# Altium project T3-COM1-2.PrjPcb (part 4 of 6)
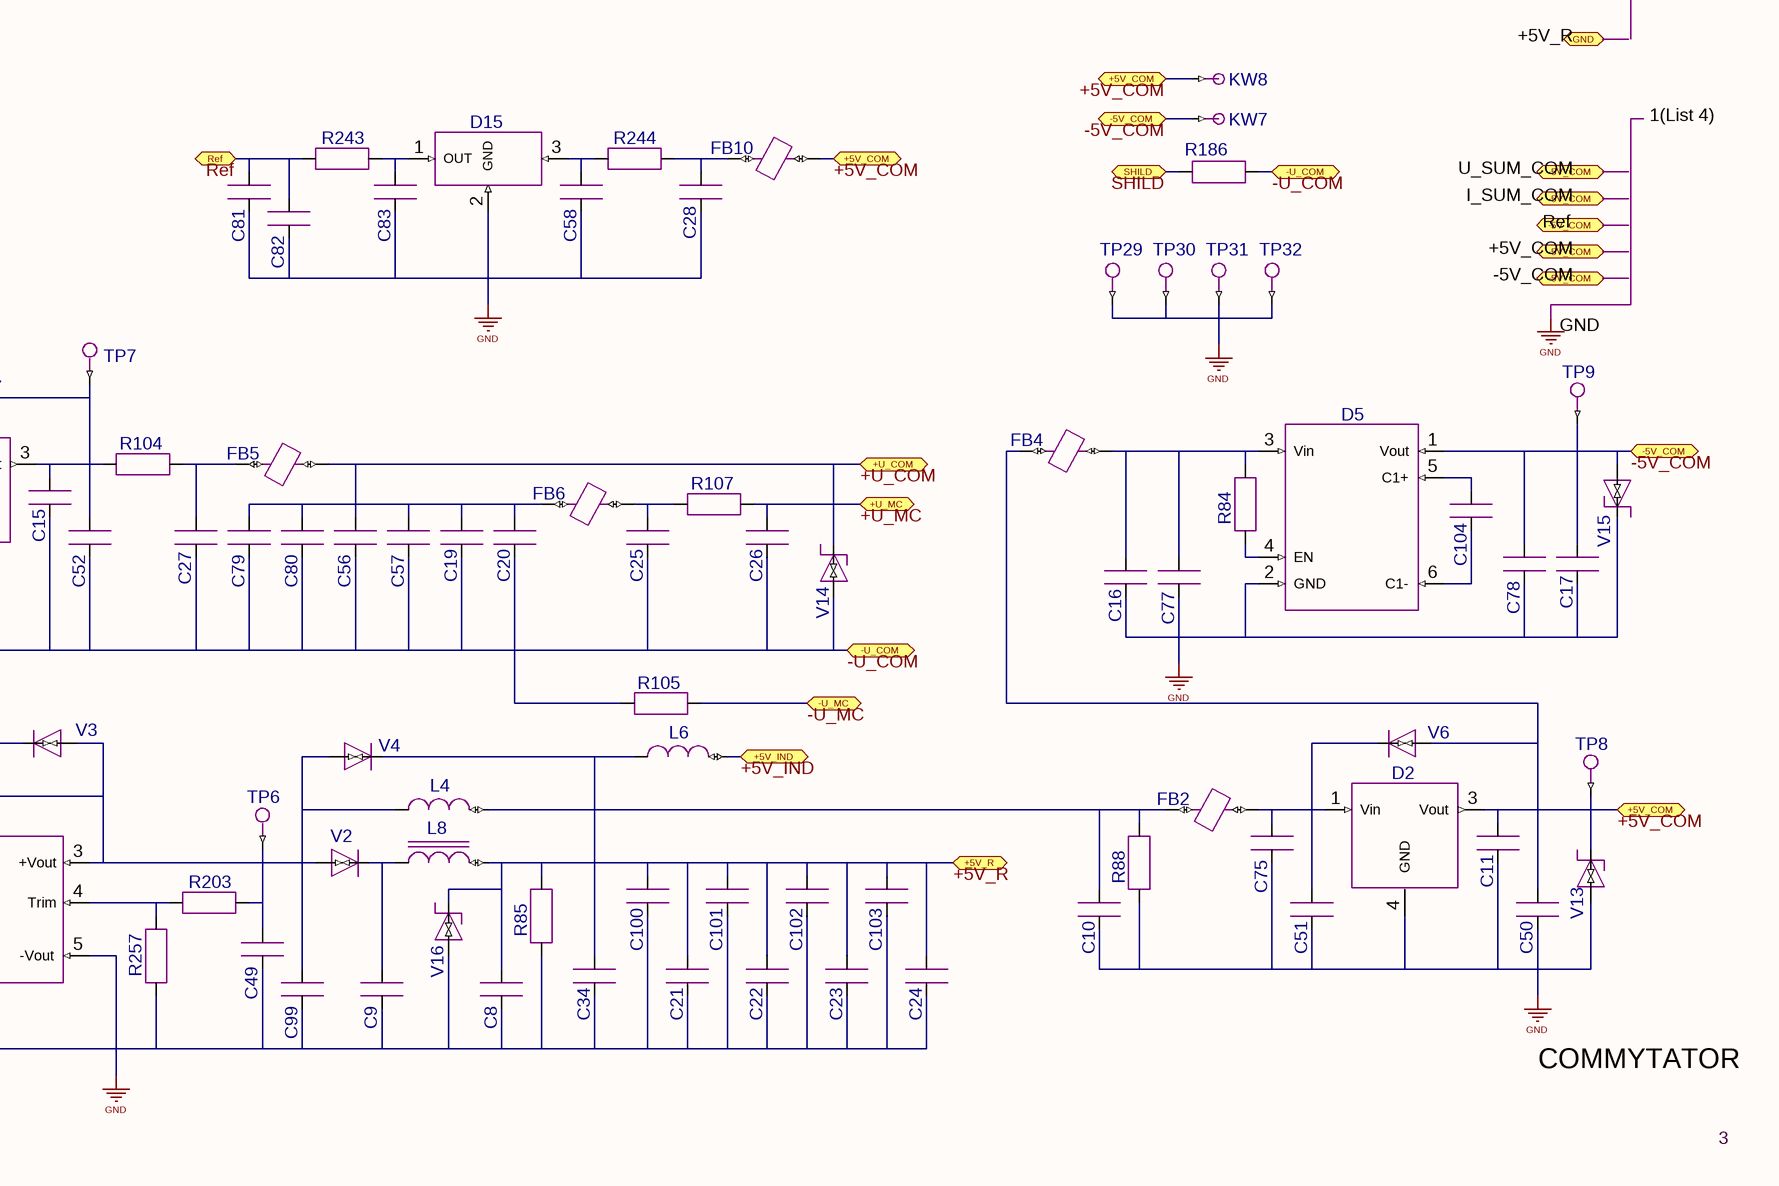
[diagram p17: Schematic1_3.SchDoc, bottom right]

## Sheet Schematic1_3.SchDoc (continued)

### Parts
C8  CAP CER 0.1UF 50V 10% X7R 0603  (value not drawn)
C9  CAP CER 0.1UF 50V 10% X7R 0603  (value not drawn)
C10  CAP CER 0.1UF 50V 10% X7R 0603  (value not drawn)
C11  CAP CER 0.1UF 50V 10% X7R 0603  (value not drawn)
C12  CAP CER 0.1UF 50V 10% X7R 0603  (value not drawn)
C13  CAP CER 0.1UF 50V 10% X7R 0603  (value not drawn)
C14  CAP CER 0.1UF 50V 10% X7R 0603  (value not drawn)
C15  CAP CER 0.1UF 50V 10% X7R 0603  (value not drawn)
C16  CAP CER 0.1UF 50V 10% X7R 0603  (value not drawn)
C17  CAP CER 0.1UF 50V 10% X7R 0603  (value not drawn)
C18  CAP CER 0.1UF 50V 10% X7R 0603  (value not drawn)
C19  CAP CER 0.1UF 50V 10% X7R 0603  (value not drawn)
C20  CAP CER 0.1UF 50V 10% X7R 0603  (value not drawn)
C21  CAP CER 0.1UF 50V 10% X7R 0603  (value not drawn)
C22  CAP CER 0.1UF 50V 10% X7R 0603  (value not drawn)
C23  CAP CER 0.1UF 50V 10% X7R 0603  (value not drawn)
C24  CAP CER 0.1UF 50V 10% X7R 0603  (value not drawn)
C25  CAP CER 0.1UF 50V 10% X7R 0603  (value not drawn)
C26  CAP CER 0.1UF 50V 10% X7R 0603  (value not drawn)
C27  CAP CER 0.1UF 50V 10% X7R 0603  (value not drawn)
C28  CAP CER 0.1UF 50V 10% X7R 0603  (value not drawn)
C29  CAP CER 0.1UF 50V 10% X7R 0603  (value not drawn)
C30  CAP CER 0.1UF 50V 10% X7R 0603  (value not drawn)
C31  CAP CER 0.1UF 50V 10% X7R 0603  (value not drawn)
C32  CAP CER 0.1UF 50V 10% X7R 0603  (value not drawn)
C33  CAP CER 0.1UF 50V 10% X7R 0603  (value not drawn)
C34  CAP CER 0.1UF 50V 10% X7R 0603  (value not drawn)
C35  CAP CER 0.1UF 50V 10% X7R 0603  (value not drawn)
C49  CAP CER 2.2UF 16V 10% X7R 0805  (value not drawn)
C50  CAP CER 2.2UF 16V 10% X7R 0805  (value not drawn)
C51  CAP CER 2.2UF 16V 10% X7R 0805  (value not drawn)
C52  CAP CER 2.2UF 16V 10% X7R 0805  (value not drawn)
C53  CAP CER 2.2UF 16V 10% X7R 0805  (value not drawn)
C54  CAP CER 2.2UF 16V 10% X7R 0805  (value not drawn)
C55  CAP CER 2.2UF 16V 10% X7R 0805  (value not drawn)
C56  CAP CER 2.2UF 16V 10% X7R 0805  (value not drawn)
C57  CAP CER 2.2UF 16V 10% X7R 0805  (value not drawn)
C58  CAP CER 2.2UF 16V 10% X7R 0805  (value not drawn)
C59  CAP CER 2.2UF 16V 10% X7R 0805  (value not drawn)
C60  CAP CER 2.2UF 16V 10% X7R 0805  (value not drawn)
C61  CAP CER 2.2UF 16V 10% X7R 0805  (value not drawn)
C62  CAP CER 2.2UF 16V 10% X7R 0805  (value not drawn)
C63  CAP CER 2.2UF 16V 10% X7R 0805  (value not drawn)
C64  CAP CER 1000PF 3KV 10% X7R 1808  (value not drawn)
C65  CAP CER 1000PF 3KV 10% X7R 1808  (value not drawn)
C66  CAP CER 0.1UF 100V X7R 1206  (value not drawn)
C67  CAP CER 0.1UF 100V X7R 1206  (value not drawn)
C68  CAP CER 0.1UF 100V X7R 1206  (value not drawn)
C69  CAP CER 0.1UF 100V X7R 1206  (value not drawn)
C70  CAP CER 4.7UF 100V X7R 1210  (value not drawn)
C71  CAP CER 4.7UF 100V X7R 1210  (value not drawn)
C75  CAP CER 10UF 16V 10% X7R 0805  (value not drawn)
C76  CAP CER 10UF 16V 10% X7R 0805  (value not drawn)
C77  CAP CER 10UF 16V 10% X7R 0805  (value not drawn)
C78  CAP CER 10UF 16V 10% X7R 0805  (value not drawn)
C79  CAP CER 10UF 16V 10% X7R 0805  (value not drawn)
C80  CAP CER 10UF 16V 10% X7R 0805  (value not drawn)
C81  CAP CER 10UF 16V 10% X7R 0805  (value not drawn)
C82  CAP CER 10UF 16V 10% X7R 0805  (value not drawn)
C83  CAP CER 10UF 16V 10% X7R 0805  (value not drawn)
C84  CAP CER 10UF 16V 10% X7R 0805  (value not drawn)
C85  CAP CER 10UF 16V 10% X7R 0805  (value not drawn)
C86  CAP CER 10UF 16V 10% X7R 0805  (value not drawn)
C98  CAP CER 10UF 25V 10% X7R 1210  (value not drawn)
C99  CAP CER 10UF 25V 10% X7R 1210  (value not drawn)
C100  CAP CER 10UF 25V 10% X7R 1210  (value not drawn)
C101  CAP CER 10UF 25V 10% X7R 1210  (value not drawn)
C102  CAP CER 10UF 25V 10% X7R 1210  (value not drawn)
C103  CAP CER 10UF 25V 10% X7R 1210  (value not drawn)
C104  CAP CER 1UF 16V 10% X7R 0805  (value not drawn)
C135  CAP CER 1000PF 50V 5% NP0 0603  (value not drawn)
C141  CAP CER 2200PF 50V 5% NP0 0805  (value not drawn)
C142  CAP ALUM 1000UF 63V 20% RADIAL  (value not drawn)
C143  CAP ALUM 1000UF 63V 20% RADIAL  (value not drawn)
D1  DC/DC CONVERTER 5V 10W  (value not drawn)
D2  IC REG LDO 5V 0.5A DPAK  (value not drawn)
D3  IC REG LDO 5V 0.5A DPAK  (value not drawn)
D4  IC REG ISOLATED 7V 286MA 12SOP  (value not drawn)
D5  IC REG SWTCHD CAP INV 6SOT23  (value not drawn)
D6  IC SWITCH DUAL SPDT 10MSOP  (value not drawn)
D9  IC GATE AND 1CH 2-INP SOT-23-5  (value not drawn)
D10  IC GATE AND 1CH 2-INP SOT-23-5  (value not drawn)
D11  IC GATE AND 1CH 2-INP SOT-23-5  (value not drawn)
D12  IC GATE AND 1CH 2-INP SOT-23-5  (value not drawn)
D13  IC GATE AND 1CH 2-INP SOT-23-5  (value not drawn)
D15  VREF 2.5V 2mV  70uA 50ppm  SOT-23-3  (value not drawn)
D22  IC GATE NAND 1CH 2-INP SOT-23-5  (value not drawn)
D23  IC GATE NAND 1CH 2-INP SOT-23-5  (value not drawn)
D36  IC SIMPLE SEQUENCER OD SC70-6  (value not drawn)
D37  IC GATE NAND 1CH 2-INP SOT-23-5  (value not drawn)
D38  ERROR_5.30mm Width  (value not drawn)
D39  ERROR_5.30mm Width  (value not drawn)
FB2  FERRITE BEAD 1000 OHM 0,4 A 0603  (value not drawn)
FB3  FERRITE BEAD 1000 OHM 0,4 A 0603  (value not drawn)
FB4  FERRITE BEAD 1000 OHM 0,4 A 0603  (value not drawn)
FB5  FERRITE BEAD 1000 OHM 0,4 A 0603  (value not drawn)
FB6  FERRITE BEAD 1000 OHM 0,4 A 0603  (value not drawn)
FB7  FERRITE BEAD 1000 OHM 0,4 A 0603  (value not drawn)
FB10  FERRITE BEAD 1800 OHM 0,2 A 0603  (value not drawn)
FB11  FERRITE BEAD 1800 OHM 0,2 A 0603  (value not drawn)
FB12  FERRITE BEAD 1800 OHM 0,2 A 0603  (value not drawn)
H1  LED 2X1.2MM 570NM GN WTR CLR SMD  (value not drawn)
H2  LED 2X1.2MM 570NM GN WTR CLR SMD  (value not drawn)
H3  LED 2X1.2MM 570NM GN WTR CLR SMD  (value not drawn)
H4  LED 2X1.2MM 570NM GN WTR CLR SMD  (value not drawn)
H21  LED 2X1.2MM 640NM RD WTR CLR SMD  (value not drawn)
H22  White LED Indication - Discrete 3.1V 0805  (value not drawn)
KW4  MGSHV-0_12-D1_3xd0.45  (value not drawn)
KW5  MGSHV-0_12-D1_3xd0.45  (value not drawn)
KW6  MGSHV-0_12-D1_3xd0.45  (value not drawn)
KW7  MGSHV-0_12-D1_3xd0.45  (value not drawn)
KW8  MGSHV-0_12-D1_3xd0.45  (value not drawn)
KW9  MGSHV-0_2-D1_6xd0.62_d1,7  (value not drawn)
KW10  MGSHV-0_2-D1_6xd0.62_d1,7  (value not drawn)
L1  INDUCTOR COMMON MODE 10UH 1.6A  (value not drawn)
L2  INDUCTOR 1UH 20% 0,75A 0,06R1210  (value not drawn)
L3  INDUCTOR 1UH 20% 0,75A 0,06R1210  (value not drawn)
L4  INDUCTOR 1UH 20% 0,75A 0,06R1210  (value not drawn)
L5  INDUCTOR 1UH 20% 0,75A 0,06R1210  (value not drawn)
L6  INDUCTOR 1UH 20% 0,75A 0,06R1210  (value not drawn)
L7  INDUCTOR 1UH 20% 0,75A 0,06R1210  (value not drawn)
L8  FIXED IND 22UH 2.5A 133 MOHM SMD  (value not drawn)
R35  RES 20K OHM 1/4W 5% 1206 SMD  (value not drawn)
R36  RES 20K OHM 1/4W 5% 1206 SMD  (value not drawn)
R37  RES 20K OHM 1/4W 5% 1206 SMD  (value not drawn)
R38  RES 20K OHM 1/4W 5% 1206 SMD  (value not drawn)
R39  RES 20K OHM 1/4W 5% 1206 SMD  (value not drawn)
R40  RES 20K OHM 1/4W 5% 1206 SMD  (value not drawn)
R84  RES 4.70K OHM 1/10W 1% 0603 SMD  (value not drawn)
R85  RES 4.70K OHM 1/10W 1% 0603 SMD  (value not drawn)
R86  RES 4.70K OHM 1/10W 1% 0603 SMD  (value not drawn)
R87  RES 4.70K OHM 1/10W 1% 0603 SMD  (value not drawn)
R88  RES 4.70K OHM 1/10W 1% 0603 SMD  (value not drawn)
R89  RES 4.70K OHM 1/10W 1% 0603 SMD  (value not drawn)
R90  RES 4.70K OHM 1/10W 1% 0603 SMD  (value not drawn)
R91  RES 4.70K OHM 1/10W 1% 0603 SMD  (value not drawn)
R92  RES 4.70K OHM 1/10W 1% 0603 SMD  (value not drawn)
R93  RES 4.70K OHM 1/10W 1% 0603 SMD  (value not drawn)
R94  RES 4.70K OHM 1/10W 1% 0603 SMD  (value not drawn)
R95  RES 4.70K OHM 1/10W 1% 0603 SMD  (value not drawn)
R96  RES 4.70K OHM 1/10W 1% 0603 SMD  (value not drawn)
R97  RES 4.70K OHM 1/10W 1% 0603 SMD  (value not drawn)
R98  RES 4.70K OHM 1/10W 1% 0603 SMD  (value not drawn)
R99  RES 4.70K OHM 1/10W 1% 0603 SMD  (value not drawn)
R100  RES 4.70K OHM 1/10W 1% 0603 SMD  (value not drawn)
R101  RES 4.70K OHM 1/10W 1% 0603 SMD  (value not drawn)
R104  RES 0.0 OHM 1/4W JUMP 1210 SMD  (value not drawn)
R105  RES 0.0 OHM 1/4W JUMP 1210 SMD  (value not drawn)
R106  RES 0.0 OHM 1/4W JUMP 1210 SMD  (value not drawn)
R107  RES 0.0 OHM 1/4W JUMP 1210 SMD  (value not drawn)
R142  RES 620 OHM 1/10W 1% 0603 SMD  (value not drawn)
R143  RES 620 OHM 1/10W 1% 0603 SMD  (value not drawn)
R144  RES 620 OHM 1/10W 1% 0603 SMD  (value not drawn)
R145  RES 620 OHM 1/10W 1% 0603 SMD  (value not drawn)
R146  RES 620 OHM 1/10W 1% 0603 SMD  (value not drawn)
R147  RES 620 OHM 1/10W 1% 0603 SMD  (value not drawn)
R148  RES 620 OHM 1/10W 1% 0603 SMD  (value not drawn)
R149  RES 620 OHM 1/10W 1% 0603 SMD  (value not drawn)
R150  RES 619 OHM 1/10W 1% 0603 SMD  (value not drawn)
R151  RES 619 OHM 1/10W 1% 0603 SMD  (value not drawn)
R152  RES 619 OHM 1/10W 1% 0603 SMD  (value not drawn)
R153  RES 619 OHM 1/10W 1% 0603 SMD  (value not drawn)
R154  RES 619 OHM 1/10W 1% 0603 SMD  (value not drawn)
R155  RES 619 OHM 1/10W 1% 0603 SMD  (value not drawn)
R156  RES 619 OHM 1/10W 1% 0603 SMD  (value not drawn)
R157  RES 619 OHM 1/10W 1% 0603 SMD  (value not drawn)
R158  RES 619 OHM 1/10W 1% 0603 SMD  (value not drawn)
R159  RES 619 OHM 1/10W 1% 0603 SMD  (value not drawn)
R160  RES 619 OHM 1/10W 1% 0603 SMD  (value not drawn)
R161  RES 619 OHM 1/10W 1% 0603 SMD  (value not drawn)
R162  RES 619 OHM 1/10W 1% 0603 SMD  (value not drawn)
R163  RES 619 OHM 1/10W 1% 0603 SMD  (value not drawn)
R164  RES 619 OHM 1/10W 1% 0603 SMD  (value not drawn)
R165  RES 619 OHM 1/10W 1% 0603 SMD  (value not drawn)
R166  RES 200 OHM 1/10W 1% 0603 SMD  (value not drawn)
R167  RES 200 OHM 1/10W 1% 0603 SMD  (value not drawn)
R168  RES 200 OHM 1/10W 1% 0603 SMD  (value not drawn)
R169  RES 200 OHM 1/10W 1% 0603 SMD  (value not drawn)
R170  RES 200 OHM 1/10W 1% 0603 SMD  (value not drawn)
R171  RES 200 OHM 1/10W 1% 0603 SMD  (value not drawn)
R172  RES 200 OHM 1/10W 1% 0603 SMD  (value not drawn)
R185  RES 0.0 OHM 1/10W 0603 SMD  (value not drawn)
R186  RES 0.0 OHM 1/10W 0603 SMD  (value not drawn)
R187  RES 0.0 OHM 1/10W 0603 SMD  (value not drawn)
R188  RES 0.0 OHM 1/10W 0603 SMD  (value not drawn)
R189  RES 0.0 OHM 1/10W 0603 SMD  (value not drawn)
R190  RES 0.0 OHM 1/10W 0603 SMD  (value not drawn)
R191  RES 0.0 OHM 1/10W 0603 SMD  (value not drawn)
R192  RES 0.0 OHM 1/10W 0603 SMD  (value not drawn)
R202  RES 10.7 OHM 1/10W 1% 0603 SMD  (value not drawn)
R203  RES 10.7 OHM 1/10W 1% 0603 SMD  (value not drawn)
R243  RES 10.0 OHM 1/10W 1% 0603 SMD  (value not drawn)
R244  RES 10.0 OHM 1/10W 1% 0603 SMD  (value not drawn)
R245  RES 10.0 OHM 1/10W 1% 0603 SMD  (value not drawn)
R246  RES 10.0 OHM 1/10W 1% 0603 SMD  (value not drawn)
R257  RES 3.40K OHM 1/10W 1% 0603 SMD  (value not drawn)
R258  RES 470 OHM 1/8W 5% 0805 SMD  (value not drawn)
R259  RES 2.40K OHM 1/8W 1% 0805 SMD  (value not drawn)
TP5  TEST POINT PC MULTI PURPOSE BLK  (value not drawn)
TP6  TEST POINT PC MULTI PURPOSE RED  (value not drawn)
TP7  TEST POINT PC MULTI PURPOSE RED  (value not drawn)
TP8  TEST POINT PC MULTI PURPOSE RED  (value not drawn)
TP9  TEST POINT PC MULTI PURPOSE RED  (value not drawn)
TP10  TEST POINT PC MULTI PURPOSE RED  (value not drawn)
TP28  TEST POINT PC MULTIPURPOSE BRWN  (value not drawn)
TP29  TEST POINT PC MULTI PURPOSE GRN  (value not drawn)
TP30  TEST POINT PC MULTI PURPOSE GRN  (value not drawn)
TP31  TEST POINT PC MULTI PURPOSE GRN  (value not drawn)
TP32  TEST POINT PC MULTI PURPOSE GRN  (value not drawn)
V1  DIODE SCHOTTKY 60V 3A SMB  (value not drawn)
V2  DIODE SCHOTTKY 60V 3A SMB  (value not drawn)
V3  DIODE SCHOTTKY 60V 3A SMB  (value not drawn)
V4  DIODE SCHOTTKY 60V 3A SMB  (value not drawn)
V5  DIODE ZENER 5.1V 200MW UMD2  (value not drawn)
V6  DIODE SWITCH 100V 0.15A SOD123  (value not drawn)
V7  DIODE SWITCH 100V 0.15A SOD123  (value not drawn)
V12  TVS DIODE 45VWM 72.7VC SOD128  (value not drawn)
V13  TVS DIODE 3.3VWM 8VC SOD128  (value not drawn)
V14  TVS DIODE 3.3VWM 8VC SOD128  (value not drawn)
V15  TVS DIODE 3.3VWM 8VC SOD128  (value not drawn)
V16  TVS DIODE 3.3VWM 8VC SOD128  (value not drawn)
V17  DIODE ZENER 3.0V 200MW UMD2  (value not drawn)
X17  CONN HEADER 2.54MM 20POS GOLD  (value not drawn)
X18  CONN HEADER 2.54MM 16POS GOLD  (value not drawn)
X22  CONN HEADER 4POS 4.2MM VERT TIN  (value not drawn)

### Ports
$3N6976, +5V_COM, +5V_IND, +5V_R, +U_COM, +U_MC, +Vin_COM, -5V_COM, -U_COM, -U_MC, -Vin_COM, BLOCING, DELAY, DELAY_WRITE, GND, I_SUM_COM, IND-CH-1, IND-CH-2, IND-CH-3, IND-CH-4, IND-CH-5, IND-CH-6, IND-CH-7, IND-CH-8, IND-CH-9, IND-CH-10, IND-CH-11, IND-CH-12, IND-CH-13, IND-CH-14, IND-CH-15, IND-CH-16, IND_BLOCING, IND_DELAY, ON-CH-1, ON-CH-2, ON-CH-3, ON-CH-4, ON-CH-5, ON-CH-6, ON-CH-7, ON-CH-8, ON-CH-9, ON-CH-10, ON-CH-11, ON-CH-12, ON-CH-13, ON-CH-14, ON-CH-15, ON-CH-16, Ref, REZET, SHILD, TABU, TABU_I, TABU_U, U_SUM_COM, WRITE

### Nets
GND: C8.1 C9.1 C10.1 C11.1 C14.1 C16.1 C17.1 C18.1 C21.1 C22.1 C23.1 C24.1 C28.1 C29.1 C30.1 C31.1 C32.1 C33.1 C34.1 C35.1 C49.1 C50.1 C51.1 C54.1 C58.1 C59.1 C60.1 C61.1 C62.2 C63.2 C65.1 C75.2 C77.2 C78.2 C81.2 C82.2 C83.2 C84.2 C85.2 C86.2 C98.1 C99.1 C100.1 C101.1 C102.1 C103.1 C135.1 C141.1 D1.5(-Vout) D2.4(GND) D4.2(-Vs1) D4.3(-Vs2) D5.2(GND) D6.3(GND) D6.4(S2A) D9.3(GND) D10.3(GND) D11.3(GND) D12.3(GND) D13.3(GND) D15.2(GND) D22.3(GND) D23.3(GND) D36.2(GND) D37.3(GND) D38.10(GND) D39.10(GND) H2.1(A) H3.2(C) R85.1 R86.1 R88.1 R106.1 R145.1 R185.2 R187.1 R188.1 R191.1 R192.1 R257.1 TP29.1 TP30.1 TP31.1 TP32.1 V13.2(A) V15.1(C) V16.2(A) V17.2(A) X18.12 X18.14
+5V_COM: C11.2 C50.2 D2.3(Vout) FB4.1 FB7.1 FB10.2 FB11.1 FB12.1 KW8.1 R143.2 R168.1 R189.1 TP8.1 V6.2(A) V13.1(C) ; port +5V_COM
+5V_IND: C33.2 C35.2 C61.2 C86.1 D12.5(Vcc) D13.5(Vcc) H21.1(A) H22.1(A) L6.2 R96.2 R97.2 X17.19 ; port +5V_IND
+5V_R: C8.2 C21.2 C22.2 C23.2 C24.2 C100.2 C101.2 C102.2 C103.2 L8.2 R85.2 V16.1(C) ; port +5V_R
+U_COM: C19.2 C20.2 C56.2 C57.2 C79.1 C80.1 FB5.2 FB6.1 R144.2 R166.1 V14.1(C) ; port +U_COM
+U_MC: C26.2 R107.1 ; port +U_MC
+Vin_COM: C66.2 L1.1 R35.2 TP10.1 X22.1 X22.3 ; port +Vin_COM
-5V_COM: C17.2 C78.1 D5.1(Vout) KW7.1 R142.2 R169.1 R190.1 TP9.1 V15.2(A) ; port -5V_COM
-U_COM: C12.1 C13.1 C15.1 C19.1 C20.1 C25.1 C26.1 C27.1 C52.1 C53.1 C55.1 C56.1 C57.1 C76.2 C79.2 C80.2 D3.4(GND) D4.12(GND) H4.2(C) R87.1 R105.2 R167.1 R186.1 TP28.1 V14.2(A) ; port -U_COM
-U_MC: R105.1 ; port -U_MC
-Vin_COM: C66.1 L1.2 R35.1 TP5.1 X22.2 X22.4 ; port -Vin_COM
BLOCING: D6.1(IN1) D9.4(Y) D12.1(A) D12.2(B) D22.1(A) R96.1 R100.1 ; port BLOCING
DELAY: D10.4(Y) D13.1(A) D13.2(B) D23.1(A) D23.2(B) R97.1 ; port DELAY
DELAY_WRITE: D23.4(Y) ; port DELAY_WRITE
I_SUM_COM: R171.1 ; port I_SUM_COM
IND-CH-1: D38.18(B1) R150.1 ; port IND-CH-1
IND-CH-2: D38.17(B2) R158.1 ; port IND-CH-2
IND-CH-3: D38.16(B3) R151.1 ; port IND-CH-3
IND-CH-4: D38.15(B4) R159.1 ; port IND-CH-4
IND-CH-5: D38.14(B5) R152.1 ; port IND-CH-5
IND-CH-6: D38.13(B6) R160.1 ; port IND-CH-6
IND-CH-7: D38.12(B7) R153.1 ; port IND-CH-7
IND-CH-8: D38.11(B8) R161.1 ; port IND-CH-8
IND-CH-9: D39.18(B1) R154.1 ; port IND-CH-9
IND-CH-10: D39.17(B2) R162.1 ; port IND-CH-10
IND-CH-11: D39.16(B3) R155.1 ; port IND-CH-11
IND-CH-12: D39.15(B4) R163.1 ; port IND-CH-12
IND-CH-13: D39.14(B5) R156.1 ; port IND-CH-13
IND-CH-14: D39.13(B6) R164.1 ; port IND-CH-14
IND-CH-15: D39.12(B7) R157.1 ; port IND-CH-15
IND-CH-16: D39.11(B8) R165.1 ; port IND-CH-16
IND_BLOCING: D12.4(Y) R146.2 R149.1 ; port IND_BLOCING
IND_DELAY: D13.4(Y) R147.2 R148.2 ; port IND_DELAY
ON-CH-1: D38.2(A1) ; port ON-CH-1
ON-CH-2: D38.3(A2) ; port ON-CH-2
ON-CH-3: D38.4(A3) ; port ON-CH-3
ON-CH-4: D38.5(A4) ; port ON-CH-4
ON-CH-5: D38.6(A5) ; port ON-CH-5
ON-CH-6: D38.7(A6) ; port ON-CH-6
ON-CH-7: D38.8(A7) ; port ON-CH-7
ON-CH-8: D38.9(A8) ; port ON-CH-8
ON-CH-9: D39.2(A1) ; port ON-CH-9
ON-CH-10: D39.3(A2) ; port ON-CH-10
ON-CH-11: D39.4(A3) ; port ON-CH-11
ON-CH-12: D39.5(A4) ; port ON-CH-12
ON-CH-13: D39.6(A5) ; port ON-CH-13
ON-CH-14: D39.7(A6) ; port ON-CH-14
ON-CH-15: D39.8(A7) ; port ON-CH-15
ON-CH-16: D39.9(A8) ; port ON-CH-16
Ref: C81.1 C82.1 R170.1 R243.1 ; port Ref
REZET: D6.5(IN2) R91.1 ; port REZET
SHILD: R186.2 ; port SHILD
TABU: D22.4(Y) ; port TABU
TABU_I: D37.1(A) D37.2(B) R95.1 ; port TABU_I
TABU_U: D22.2(B) R94.1 ; port TABU_U
U_SUM_COM: R172.1 ; port U_SUM_COM
WRITE: D11.1(A) D11.2(B) R101.1 ; port WRITE
NetC9_2: C9.2 L8.1 V2.1(C)
NetC10_2: C10.2 FB2.1 L4.2 R88.2
NetC12_2: C12.2 FB3.1 L5.2 R87.2
NetC13_2: C13.2 C55.2 D4.13(+Vout) L5.1
NetC14_2: C14.2 C54.2 C98.2 D4.1(+Vs) L3.2 R86.2
NetC15_2: C15.2 C52.2 D3.3(Vout) R104.2 TP7.1 V7.2(A)
NetC16_2: C16.2 C77.1 D5.3(Vin) FB4.2 R84.2
NetC18_2: C18.2 L3.1 V3.1(C)
NetC25_2: C25.2 FB6.2 R107.2
NetC27_2: C27.2 FB5.1 R104.1
NetC28_2: C28.2 FB10.1 R244.2
NetC29_2: C29.2 C32.2 C60.2 C84.1 D6.8(Vdd) D9.5(Vcc) D22.5(Vcc) D37.5(Vcc) R89.2 R90.2 R91.2 R94.2 R95.2 R100.2 R246.1
NetC30_2: C30.2 C59.2 C85.1 D10.5(Vcc) D11.5(Vcc) D23.5(Vcc) R92.2 R93.2 R101.2 R245.1 R258.2
NetC31_2: C31.2 D36.6(Vcc) R258.1 V17.1(C)
NetC34_2: C34.2 L6.1 V4.1(C)
NetC49_2: C49.2 C64.1 C99.2 D1.3(+Vout) L4.1 R203.2 TP6.1 V2.2(A) V3.2(A) V4.2(A)
NetC51_2: C51.2 C75.1 D2.1(Vin) FB2.2 V6.1(C)
NetC53_2: C53.2 C76.1 D3.1(Vin) FB3.2 V7.1(C)
NetC58_2: C58.2 D15.3(IN) R244.1
NetC62_1: C62.1 C63.1 D38.20(Vcc) D39.20(Vcc) FB7.2 R98.1 R99.1
NetC64_2: C64.2 C69.2 C70.2 C71.2 C142.1(C_pos) C143.1(C_pos) D1.1(+Vin) L2.2 R36.2 R37.2 R38.2 R39.2 R40.2
NetC65_2: C65.2 C69.1 C70.1 C71.1 C142.2(C_neg) C143.2(C_neg) D1.2(-Vin) H1.2(C) L7.2 R36.1 R202.1 V5.2(A)
NetC67_1: C67.1 C68.1 L1.3 L7.1 V12.2(A)
NetC67_2: C67.2 L1.4 V1.2(A) V12.1(C)
NetC68_2: C68.2 L2.1 V1.1(C)
NetC83_1: C83.1 D15.1(OUT) R243.2
NetC104_1: C104.1 D5.6(C1-)
NetC104_2: C104.2 D5.5(C1+)
NetC135_2: C135.2 D36.3(Vin) R145.2 R259.2
NetC141_2: C141.2 D36.5(CEXT)
NetD1_4: D1.4(Trim) R203.1 R257.2
NetD1_6: D1.6(On/Off) R38.1 R39.1 R202.2 V5.1(C)
NetD5_4: D5.4(EN) R84.1
NetD6_6: D6.6(D2) D6.10(D1)
NetD6_9: D6.9(S1B) D9.1(A) R90.1
NetD9_2: D9.2(B) D37.4(Y) R89.1
NetD10_1: D10.1(A) D10.2(B) D36.4(~{ENOUT}) R93.1
NetD11_4: D11.4(Y) R259.1
NetD36_1: D36.1(~{ENIN}) R92.1 R185.1
NetD38_1: D38.1(DIR) R98.2
NetD38_19: D38.19(~{OE}) R187.2
NetD39_1: D39.1(DIR) R99.2
NetD39_19: D39.19(~{OE}) R188.2
NetFB11_2: FB11.2 R245.2
NetFB12_2: FB12.2 R246.2
NetH1_1: H1.1(A) R37.1 R40.1
NetH2_2: H2.2(C) R142.1
NetH3_1: H3.1(A) R143.1
NetH4_1: H4.1(A) R144.1
NetH21_2: H21.2(C) R146.1
NetH22_2: H22.2(C) R147.1
NetKW4_1: KW4.1 X18.7
NetKW5_1: KW5.1 X18.9
NetKW6_1: KW6.1 X18.6
NetKW9_1: KW9.1 R191.2
NetKW10_1: KW10.1 R192.2
NetR106_2: R106.2 X17.20
NetR148_1: R148.1 X18.3
NetR149_2: R149.2 X18.5
NetR150_2: R150.2 X17.1
NetR151_2: R151.2 X17.3
NetR152_2: R152.2 X17.5
NetR153_2: R153.2 X17.7
NetR154_2: R154.2 X17.9
NetR155_2: R155.2 X17.11
NetR156_2: R156.2 X17.13
NetR157_2: R157.2 X17.15
NetR158_2: R158.2 X17.2
NetR159_2: R159.2 X17.4
NetR160_2: R160.2 X17.6
NetR161_2: R161.2 X17.8
NetR162_2: R162.2 X17.10
NetR163_2: R163.2 X17.12
NetR164_2: R164.2 X17.14
NetR165_2: R165.2 X17.16
NetR166_2: R166.2 X18.16
NetR167_2: R167.2 X18.15
NetR168_2: R168.2 X18.8
NetR169_2: R169.2 X18.11
NetR170_2: R170.2 X18.1
NetR171_2: R171.2 X18.2
NetR172_2: R172.2 X18.4
NetR189_2: R189.2 X18.10
NetR190_2: R190.2 X18.13

Not connected (* = marked no-connect by the designer): D4 14(NC1) 15(NC2) 16(NC3) 17(NC4) 26(NC5) 27(NC6) 28(SYNC); D6 2(S1A) 7(S2B); X17 17 18

### Notes on the sheet
- CONTROL
- 1(List 1)
- ON-CH-1
- ON-CH-2
- ON-CH-3
- ON-CH-4
- ON-CH-5
- ON-CH-6
- ON-CH-7
- ON-CH-8
- ON-CH-9
- ON-CH-10
- ON-CH-11
- ON-CH-12
- ON-CH-13
- ON-CH-14
- ON-CH-15
- ON-CH-16
- WRITE
- TABU
- DELFY_WRITE
- DELAY
- BLOCING
- REZET
- +5V_COM
- +U_COM
- -U_COM
- +Vin_COM
- -Vin_COM
- +U_MC
- -U_MC
- SHILD
- GND
- 1(List 2)
- +5V_R
- 1(List 4)
- I_SUM_COM
- U_SUM_COM
- Ref
- -5V_COM
- COMMYTATOR
- 3
- Labels drawn without touching a wire or pin: GND
- (in symbol DC/DC CONVERTER 5V 10W) DC/DC
- (in symbol IC GATE AND 1CH 2-INP SOT-23-5) &
- (in symbol IC GATE NAND 1CH 2-INP SOT-23-5) &
- (in symbol IC REG ISOLATED 7V 286MA 12SOP) DC/DC